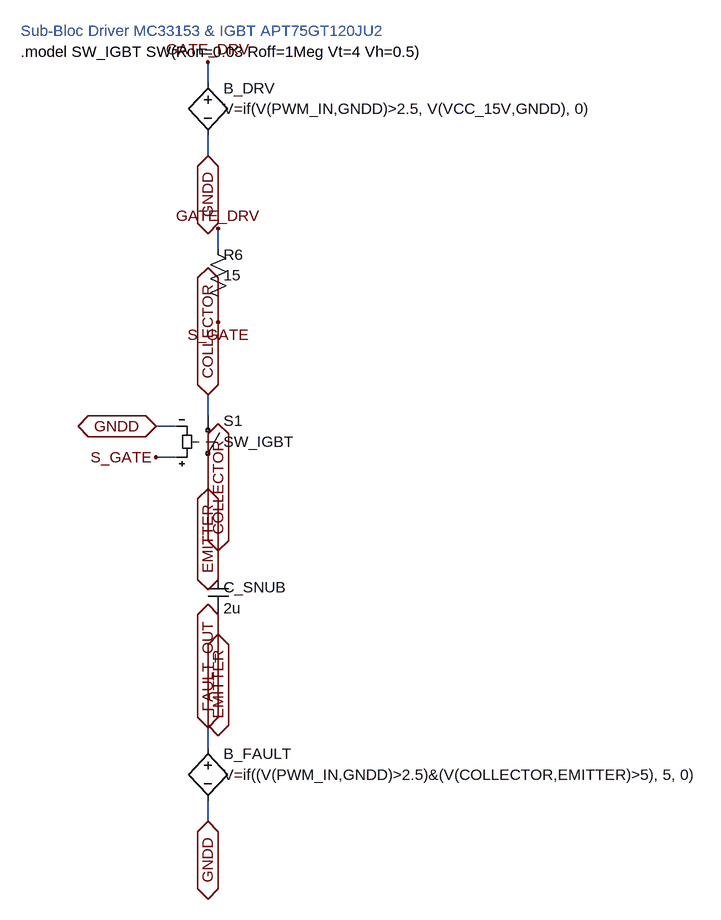
[diagram p0: schematic sub_driver_igbt.asc]
sub_driver_igbt.asc, the LTspice schematic file:
Version 4
SHEET 1 3200 2400
TEXT 32 32 Left 2 ;Sub-Bloc Driver MC33153 & IGBT APT75GT120JU2
TEXT 32 64 Left 2 !.model SW_IGBT SW(Ron=0.03 Roff=1Meg Vt=4 Vh=0.5)
SYMBOL bv 320 96 R0
WINDOW 0 24 24 Left 2
WINDOW 3 24 56 Left 2
SYMATTR InstName B_DRV
SYMATTR Value V=if(V(PWM_IN,GNDD)>2.5, V(VCC_15V,GNDD), 0)
WIRE 320 112 320 80
FLAG 320 80 GATE_DRV
WIRE 320 192 320 224
FLAG 320 224 GNDD
IOPIN 320 224 BiDir
SYMBOL res 320 352 R0
WINDOW 0 24 24 Left 2
WINDOW 3 24 56 Left 2
SYMATTR InstName R6
SYMATTR Value 15
WIRE 336 368 336 336
FLAG 336 336 GATE_DRV
WIRE 336 448 336 480
FLAG 336 480 S_GATE
SYMBOL sw 320 608 R0
WINDOW 0 24 24 Left 2
WINDOW 3 24 56 Left 2
SYMATTR InstName S1
SYMATTR Value SW_IGBT
WIRE 320 624 320 592
FLAG 320 592 COLLECTOR
IOPIN 320 592 BiDir
WIRE 320 704 320 736
FLAG 320 736 EMITTER
IOPIN 320 736 BiDir
WIRE 272 688 240 688
FLAG 240 688 S_GATE
WIRE 272 640 240 640
FLAG 240 640 GNDD
IOPIN 240 640 BiDir
SYMBOL cap 320 864 R0
WINDOW 0 24 24 Left 2
WINDOW 3 24 56 Left 2
SYMATTR InstName C_SNUB
SYMATTR Value 2u
WIRE 336 864 336 832
FLAG 336 832 COLLECTOR
IOPIN 336 832 BiDir
WIRE 336 928 336 960
FLAG 336 960 EMITTER
IOPIN 336 960 BiDir
SYMBOL bv 320 1120 R0
WINDOW 0 24 24 Left 2
WINDOW 3 24 56 Left 2
SYMATTR InstName B_FAULT
SYMATTR Value V=if((V(PWM_IN,GNDD)>2.5)&(V(COLLECTOR,EMITTER)>5), 5, 0)
WIRE 320 1136 320 1104
FLAG 320 1104 FAULT_OUT
IOPIN 320 1104 BiDir
WIRE 320 1216 320 1248
FLAG 320 1248 GNDD
IOPIN 320 1248 BiDir

The netlist it stands for:
* sub_driver_igbt.asc
B_DRV GATE_DRV GNDD V=if(V(PWM_IN,GNDD)>2.5, V(VCC_15V,GNDD), 0)
R6 GATE_DRV S_GATE 15
S1 COLLECTOR EMITTER S_GATE GNDD SW_IGBT
C_SNUB COLLECTOR EMITTER 2u
B_FAULT FAULT_OUT GNDD V=if((V(PWM_IN,GNDD)>2.5)&(V(COLLECTOR,EMITTER)>5), 5, 0)
* Sub-Bloc Driver MC33153 & IGBT APT75GT120JU2
.model SW_IGBT SW(Ron=0.03 Roff=1Meg Vt=4 Vh=0.5)
.backanno
.end